# Altium schematic sheet USB.SchDoc
size A4; SheetNumber: 4; SheetTotal: 7
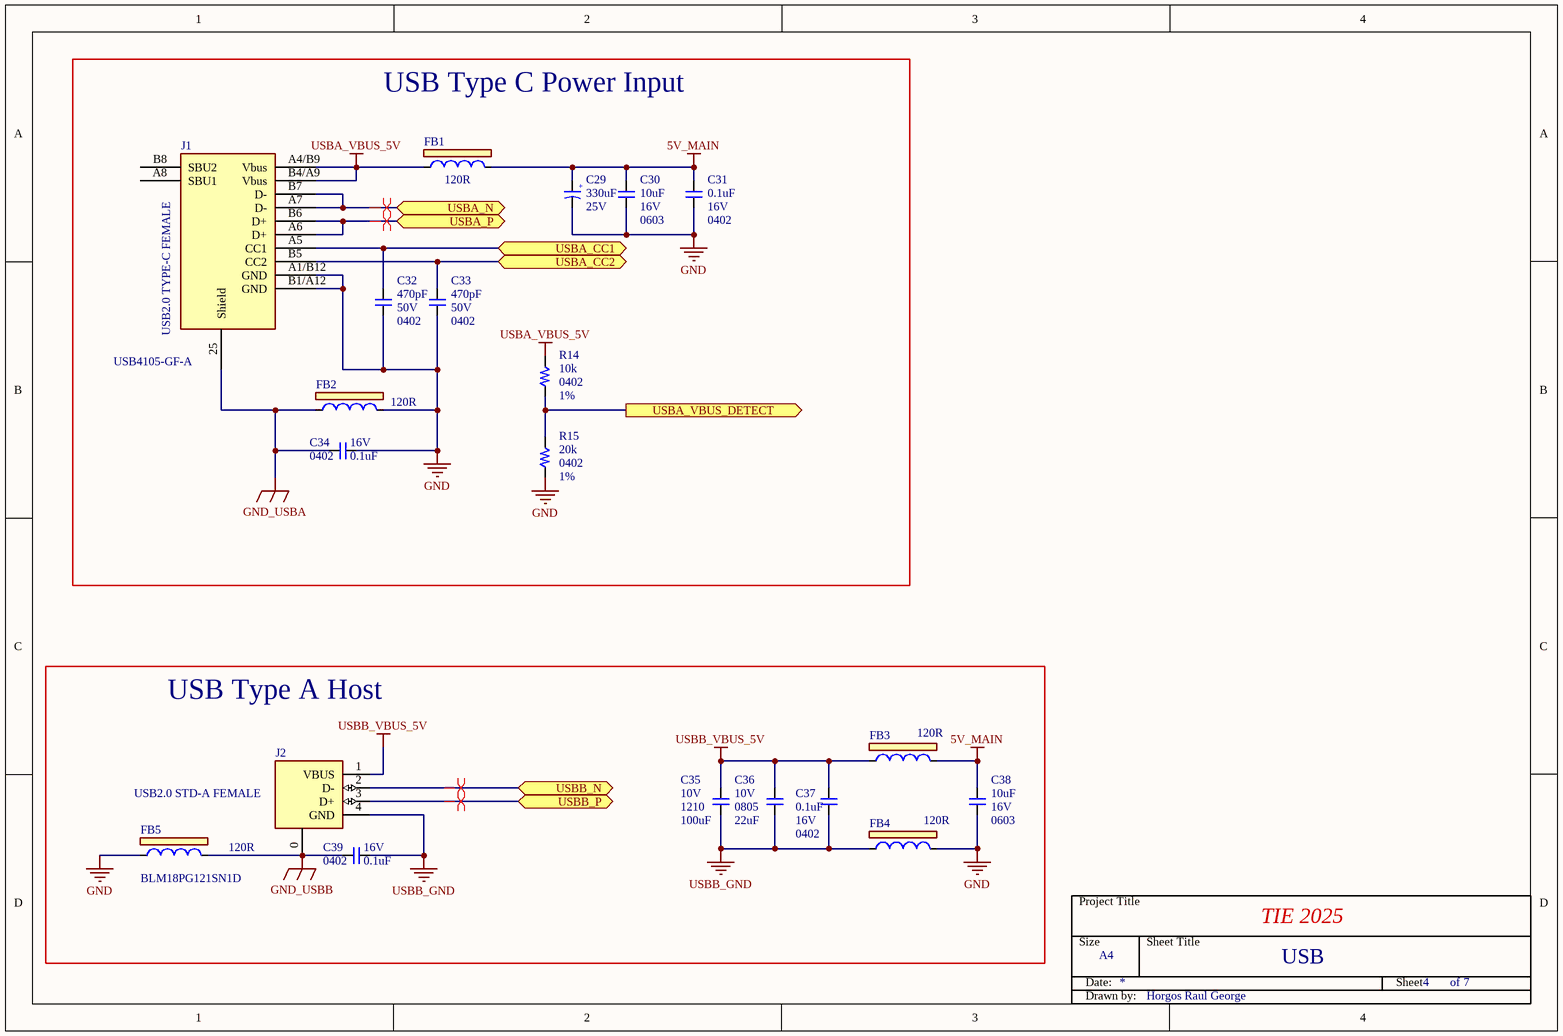
[diagram p0: USB.SchDoc]

## Parts
C29  330uF  Rated Voltage: 25V  [CAP ALU]
C30  10uF  Rated Voltage: 16V  Pacakage: 0603  [CAP0603]
C31  0.1uF  Rated Voltage: 16V  Package: 0402  [CAP0402]
C32  470pF  Rated Voltage: 50V  Package: 0402  [CAP0402]
C33  470pF  Rated Voltage: 50V  Package: 0402  [CAP0402]
C34  0.1uF  Rated Voltage: 16V  Package: 0402  [CAP0402]
C35  100uF  Rated Voltage: 10V  Package: 1210  [CAP1210]
C36  22uF  Rated Voltage: 10V  Package: 0805  [CAP0805]
C37  0.1uF  Rated Voltage: 16V  Package: 0402  [CAP0402]
C38  10uF  Rated Voltage: 16V  Pacakage: 0603  [CAP0603]
C39  0.1uF  Rated Voltage: 16V  Package: 0402  [CAP0402]
FB1  120R  [FB0603]
FB2  120R  [FB0603]
FB3  120R  [FB0603]
FB4  120R  [FB0603]
FB5  120R  [FB0603]
J1  USB2.0 TYPE-C FEMALE  [USB4105-GF-A]
J2  USB2.0 STD-A FEMALE  [292303-1]
R14  10k  Tolerance: 1%  Package: 0402  [RES0402]
R15  20k  Tolerance: 1%  Package: 0402  [RES0402]
Title_4  Title Block  (value not drawn)  (graphical)

## Blocks framed on the sheet
USB Type C Power Input: C29-C34 FB1 FB2 J1 R14 R15
USB Type A Host: C35-C39 FB3-FB5 J2

## Ports
USBA_CC1 (bidir, see MPU-System[2A]), USBA_CC2 (bidir, see MPU-System[2A]), USBA_N (bidir, see MPU-System[2A]), USBA_P (bidir, see MPU-System[2A]), USBA_VBUS_DETECT (out), USBB_N (bidir, see MPU-System[2B]), USBB_P (bidir, see MPU-System[2B])

## Nets
5V_MAIN: C29.1 C30.2 C31.2 C38.2 FB1.2 FB3.2
GND: C29.2 C30.1 C31.1 C32.1 C33.1 C34.1 C38.1 FB2.2 FB4.2 FB5.1 J1.A1/B12(GND) J1.B1/A12(GND) R15.1
GND_USBA: C34.2 FB2.1 J1.25(Shield)
GND_USBB: C39.2 FB5.2 J2.0
USBA_VBUS_5V: FB1.1 J1.A4/B9(Vbus) J1.B4/A9(Vbus) R14.2
USBB_GND: C35.1 C36.1 C37.1 C39.1 FB4.1 J2.4(GND)
USBB_VBUS_5V: C35.2 C36.2 C37.2 FB3.1 J2.1(VBUS)
USBA_CC1: C32.2 J1.A5(CC1) ; port USBA_CC1
USBA_CC2: C33.2 J1.B5(CC2) ; port USBA_CC2
USBA_N: J1.A7(D-) J1.B7(D-) ; port USBA_N
USBA_P: J1.A6(D+) J1.B6(D+) ; port USBA_P
USBA_VBUS_DETECT: R14.1 R15.2 ; port USBA_VBUS_DETECT
USBB_N: J2.2(D-) ; port USBB_N
USBB_P: J2.3(D+) ; port USBB_P

Not connected (* = marked no-connect by the designer): J1 A8(SBU1) B8(SBU2)

## Layout directives
differential pair: USBA_N, USBA_P, USBB_N, USBB_P

## Notes on the sheet
- USB
- (in symbol Title Block) Project Title; TIE 2025; Size; Sheet Title; A4; Date:; Sheet; of; Drawn by:; Horgos Raul George
- (in symbol UWT1E331MNL1GS) +

## Library data of the parts
C29 = UWT1E331MNL1GS: CAP ALU 330uF 25V 20% SMD F; Manufacturer: Nichicon; Manufacturer Part Number: UWT1E331MNL1GS
C30 C38 = GRT188R61C106KE13D: CAP CER 10uF 16V 10% X5R SMD 0603 AEC-Q200; Manufacturer: Murata; .Checked_PCB: IC; Manufacturer Part Number: GRT188R61C106KE13D; .Checked_SCH: IC; .Creator: IC
C31 C34 C37 C39 = C0402C104K4RAC7867: CAP CER 0.1uF 16V 10% X7R SMD 0402; Manufacturer: KEMET; .Checked_PCB: AI; Manufacturer Part Number: C0402C104K4RAC7867; .Checked_SCH: AI; .Creator: AI
C32 C33 = GRM1555C1H471JA01D: CAP CER 470pF 50V 5% NP0 SMD 0402; Manufacturer: Murata; .Checked_PCB: AI; Manufacturer Part Number: GRM1555C1H471JA01D; .Checked_SCH: AI; .Creator: AI
C35 = GRM32ER61A107ME20L: CAP CER 100uF 10V 20% X5R SMD 1210; Manufacturer: Murata Electronics North; .Checked_PCB: IC; Manufacturer Part Number: GRM32ER61A107ME20L; .Checked_SCH: IC
C36 = C2012X7S1A226M125AC: CAP CER 22uF 10V 20% X7S SMD 0805; Manufacturer: TDK Corporation; Manufacturer Part Number: C2012X7S1A226M125AC
FB1-FB5 = BLM18PG121SN1D: FERRITE BEAD 120 OHM 0603 1LN; Manufacturer: Murata; .Checked_PCB: AI; .Checked_SCH: AI; .Creator: AI
  FB5: Manufacturer Part Number: BLM18PG121SN1D
J1 = USB4105-GF-A: CONN USB2.0 TYPE-C Female SMD/TH R/A; Manufacturer: GCT; Manufacturer Part Number: USB4105-GF-A
J2 = 292303-1: CON USB2.0 STD-A FEMALE TH R/A; Manufacturer: TE Connectivity AMP; Manufacturer Part Number: 292303-1
R14 = ERJ-2RKF1002X: RES TKF 10k 1% 1/10W SMD 0402; Manufacturer: Panasonic; Manufacturer Part Number: ERJ-2RKF1002X
R15 = RMCF0402FT20K0: RES TKF 20k 1% 1/10W SMD 0402; Manufacturer: Stackpole Electronics Inc; Manufacturer Part Number: RMCF0402FT20K0